# Altium schematic sheet Top_Sheet.SchDoc
size A4; SheetNumber: 1; SheetTotal: 4
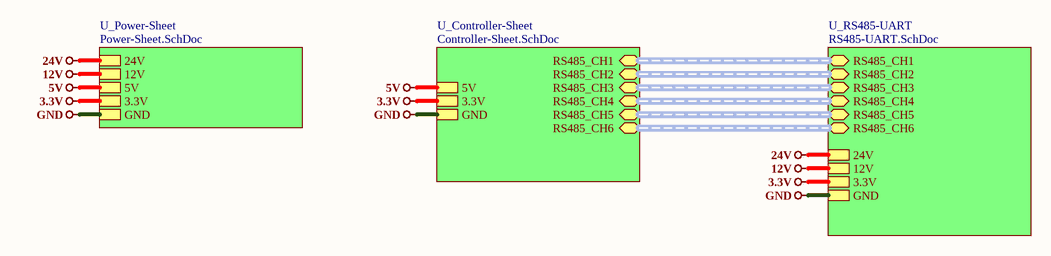
[diagram p0: Top_Sheet.SchDoc]

## Sub-sheets
U_Controller-Sheet = Controller-Sheet.SchDoc: RS485_CH1 (bidir, harness RS485_CH1), RS485_CH2 (bidir, harness RS485_CH2), RS485_CH3 (bidir, harness RS485_CH3), RS485_CH4 (bidir, harness RS485_CH4), RS485_CH5 (bidir, harness RS485_CH5), RS485_CH6 (bidir, harness RS485_CH6), GND, 3.3V, 5V
U_Power-Sheet = Power-Sheet.SchDoc: GND, 3.3V, 12V, 24V, 5V
U_RS485-UART = RS485-UART.SchDoc: RS485_CH1 (bidir, harness RS485_CH1), RS485_CH2 (bidir, harness RS485_CH2), RS485_CH3 (bidir, harness RS485_CH3), RS485_CH4 (bidir, harness RS485_CH4), RS485_CH5 (bidir, harness RS485_CH5), RS485_CH6 (bidir, harness RS485_CH6), GND, 3.3V, 12V, 24V

## Nets
3.3V: sheet U_Controller-Sheet/3.3V, sheet U_Power-Sheet/3.3V, sheet U_RS485-UART/3.3V
5V: sheet U_Controller-Sheet/5V, sheet U_Power-Sheet/5V
12V: sheet U_Power-Sheet/12V, sheet U_RS485-UART/12V
24V: sheet U_Power-Sheet/24V, sheet U_RS485-UART/24V
GND: sheet U_Controller-Sheet/GND, sheet U_Power-Sheet/GND, sheet U_RS485-UART/GND

## Buses and harness runs
harness sheet U_Controller-Sheet/RS485_CH1 = sheet U_RS485-UART/RS485_CH1
harness sheet U_Controller-Sheet/RS485_CH2 = sheet U_RS485-UART/RS485_CH2
harness sheet U_Controller-Sheet/RS485_CH3 = sheet U_RS485-UART/RS485_CH3
harness sheet U_Controller-Sheet/RS485_CH4 = sheet U_RS485-UART/RS485_CH4
harness sheet U_Controller-Sheet/RS485_CH5 = sheet U_RS485-UART/RS485_CH5
harness sheet U_Controller-Sheet/RS485_CH6 = sheet U_RS485-UART/RS485_CH6